# Altium schematic sheet Connectors.SchDoc
size A; SheetNumber: 2; SheetTotal: 2
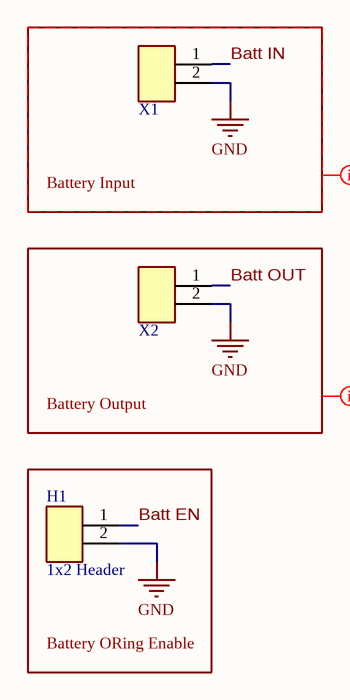
[diagram p0: Connectors.SchDoc]

## Parts
H1  1x2 Header  [[Header] 1x2 Male]
X1  2pin Screw Terminal  [[Screw Terminal] 2pin 5mm]  (value not drawn)
X2  2pin Screw Terminal  [[Screw Terminal] 2pin 5mm]  (value not drawn)

## Blocks framed on the sheet
Battery Input: X1
Battery Output: X2
Battery ORing Enable: H1

## Nets
GND: H1.2 X1.2 X2.2
Batt EN: H1.1
Batt IN: X1.1
Batt OUT: X2.1

## Layout directives
net class Supply_Nets: (no net found under the mark), Batt IN, GND

## Library data of the parts
H1 = [Header] 1x2 Male: 2.54mm pitch
X1 X2 = [Screw Terminal] 2pin: TB002-500-02BE; Supplier 1: DigiKey; Supplier Part Number 1: 102-6145-ND